# Altium schematic sheet 08_ANALOG_OUTPUTS.SchDoc: Схема электрическая принципиальная
size 420 x 297 mm; ApprovedBy: Скрябин; CheckedBy: Скрябин; Author: Корсунов; CompanyName: РТУ МИРЭА; SheetNumber: 8; SheetTotal: 11; PageSetup: Record=PageOptions|CenterHorizontal=True|CenterVertical=True|PrintScale=0.94|XCorrection=1.00|YCorrection=1.00|PrintKind=1|BorderSize=5000000|LeftOffset=0|BottomOffset=0|Orientation=1|PaperLength=1000|PaperWidth=1000|Scale=100|PaperSource=7|PrintQuality=-4|MediaType=1|DitherType=10|PaperKind=A4|PrintScaleMode=1; DecimalNumber: RP23.000001.008 Э3; Name1: Модуль ввода-вывода; lit_A: О; Name2: RP2350 OPC UA
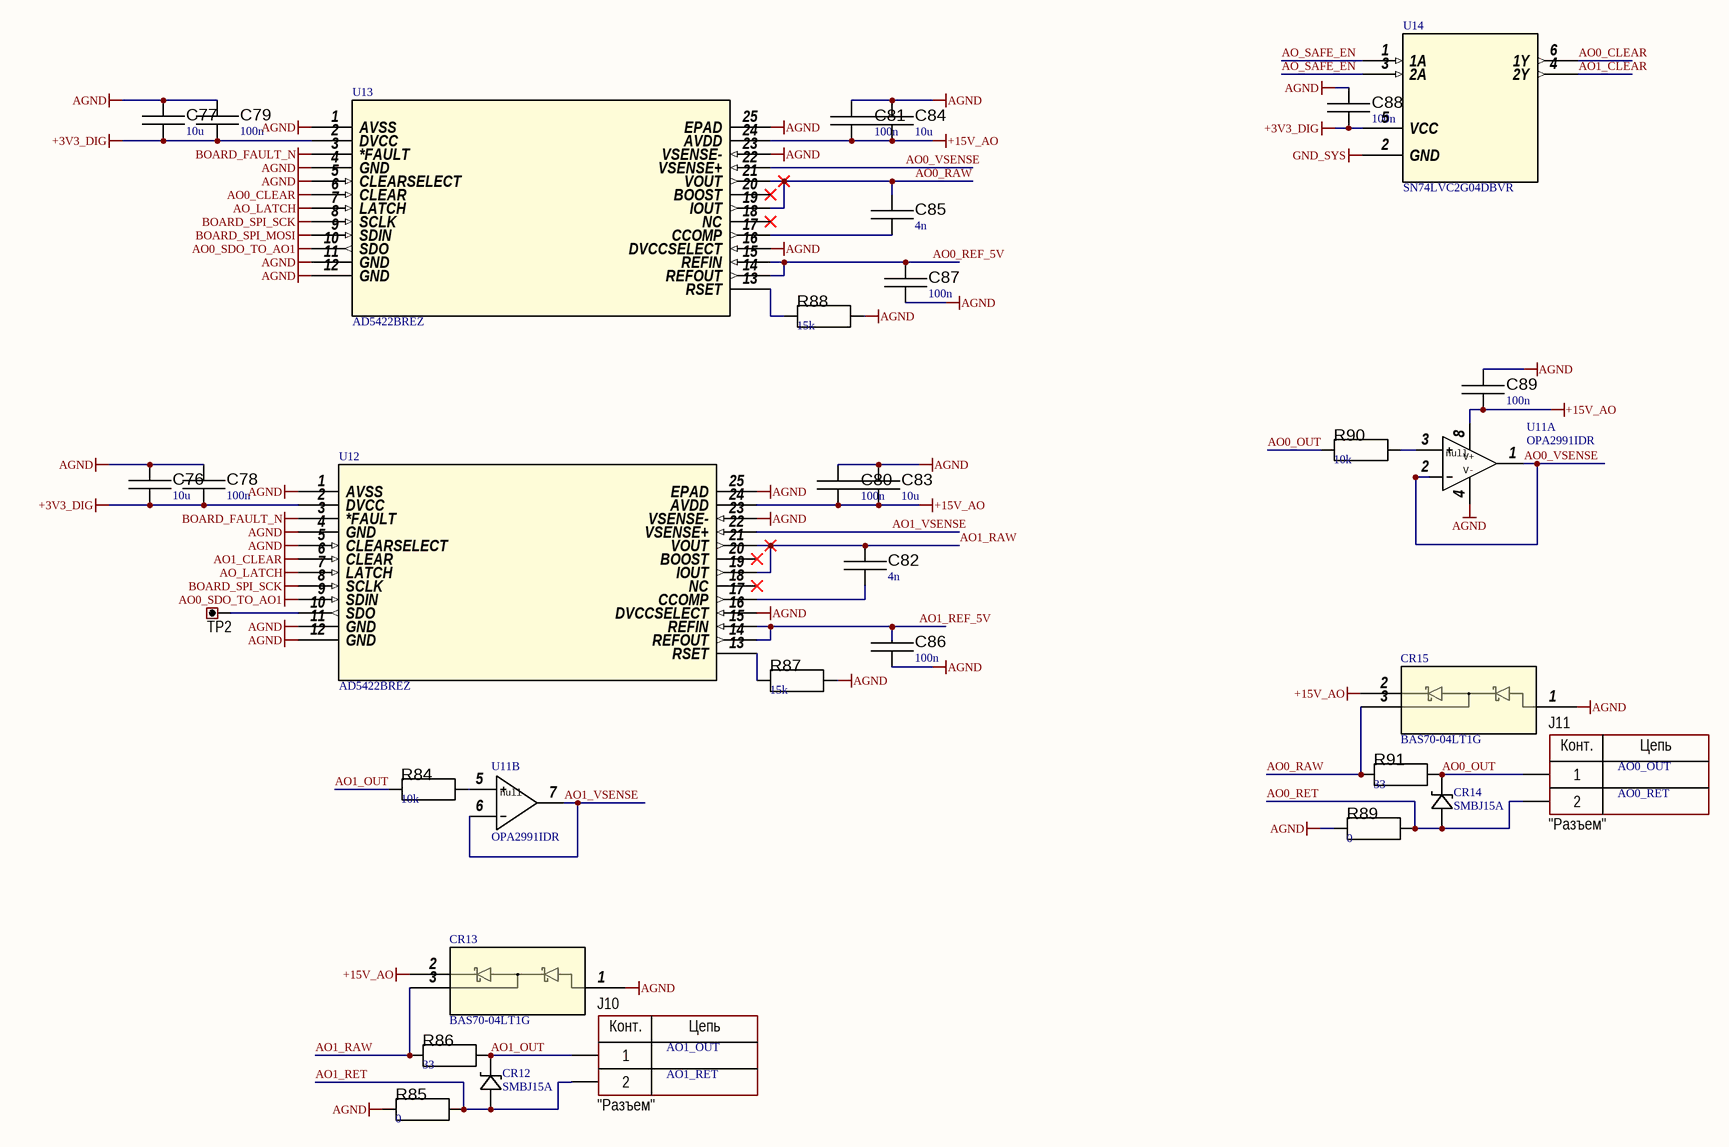
[diagram p0: 08_ANALOG_OUTPUTS.SchDoc]

## Parts
C76  value 10u  [C_0805]  (hidden comment: Capacitor)
C77  value 10u  [C_0805]  (hidden comment: Capacitor)
C78  value 100n  [C_0603]  (hidden comment: Capacitor)
C79  value 100n  [C_0603]  (hidden comment: Capacitor)
C80  value 100n  [C_0805]  (hidden comment: Capacitor)
C81  value 100n  [C_0805]  (hidden comment: Capacitor)
C82  value 4n  [C_0603]  (hidden comment: Capacitor)
C83  value 10u  [C_1206]  (hidden comment: Capacitor)
C84  value 10u  [C_1206]  (hidden comment: Capacitor)
C85  value 4n  [C_0603]  (hidden comment: Capacitor)
C86  value 100n  [C_0603]  (hidden comment: Capacitor)
C87  value 100n  [C_0603]  (hidden comment: Capacitor)
C88  value 100n  [C_0603]  (hidden comment: Capacitor)
C89  value 100n  [C_0805]  (hidden comment: Capacitor)
CR12  SMBJ15A  [DO-214AASMB_J-BEND_LTF]
CR13  BAS70-04LT1G  [SOT-23TO-236_318-08_ONS]
CR14  SMBJ15A  [DO-214AASMB_J-BEND_LTF]
CR15  BAS70-04LT1G  [SOT-23TO-236_318-08_ONS]
J10  CommentText: "Разъем"  [CON: DG350-3.5-02P]
J11  CommentText: "Разъем"  [CON: DG350-3.5-02P]
R84  value 10k  [R_0603]  (hidden comment: Resistor)
R85  value 0  [R_0603]  (hidden comment: Resistor)
R86  value 33  [R_0603]  (hidden comment: Resistor)
R87  value 15k  [R_0603]  (hidden comment: Resistor)
R88  value 15k  [R_0603]  (hidden comment: Resistor)
R89  value 0  [R_0603]  (hidden comment: Resistor)
R90  value 10k  [R_0603]  (hidden comment: Resistor)
R91  value 33  [R_0603]  (hidden comment: Resistor)
TP2  (no value)  [CON: 5000 (Keystone)]
U11  OPA2991IDR  [D0008A-IPC_A]  (parts A,B of 2)
U12  AD5422BREZ  [RE_24_ADI]
U13  AD5422BREZ  [RE_24_ADI]
U14  SN74LVC2G04DBVR  [DBV6]

## Nets
+3V3_DIG: C76.2 C77.2 C78.2 C79.2 C88.2 U12.2(DVCC) U13.2(DVCC) U14.5(VCC)
+15V_AO: C80.1 C81.1 C83.1 C84.1 C89.1 CR13.2 CR15.2 U11.8(V+) U12.24(AVDD) U13.24(AVDD)
AGND: C76.1 C77.1 C78.1 C79.1 C80.2 C81.2 C83.2 C84.2 C86.1 C87.1 C88.1 C89.2 CR13.1 CR15.1 R85.1 R87.2 R88.2 R89.1 U11.4(V-) U12.1(AVSS) U12.4(GND) U12.5(CLEARSELECT) U12.11(GND) U12.12(GND) U12.16(DVCCSELECT) U12.23(VSENSE-) U12.25(EPAD) U13.1(AVSS) U13.4(GND) U13.5(CLEARSELECT) U13.11(GND) U13.12(GND) U13.16(DVCCSELECT) U13.23(VSENSE-) U13.25(EPAD)
AO0_CLEAR: U13.6(CLEAR) U14.6(1Y)
AO0_SDO_TO_AO1: U12.9(SDIN) U13.10(SDO)
AO1_CLEAR: U12.6(CLEAR) U14.4(2Y)
AO_LATCH: U12.7(LATCH) U13.7(LATCH)
BOARD_FAULT_N: U12.3(*FAULT) U13.3(*FAULT)
BOARD_SPI_MOSI: U13.9(SDIN)
BOARD_SPI_SCK: U12.8(SCLK) U13.8(SCLK)
GND_SYS: U14.2(GND)
AO0_OUT: CR14.1 J11.1 R90.1 R91.2
AO0_RAW: C85.1 CR15.3 R91.1 U13.19(IOUT) U13.21(VOUT)
AO0_REF_5V: C87.2 U13.14(REFOUT) U13.15(REFIN)
AO0_RET: CR14.2 J11.2 R89.2
AO0_VSENSE: U11.1(OUT1) U11.2(IN1-) U13.22(VSENSE+)
AO1_OUT: CR12.1 J10.1 R84.1 R86.2
AO1_RAW: C82.1 CR13.3 R86.1 U12.19(IOUT) U12.21(VOUT)
AO1_REF_5V: C86.2 U12.14(REFOUT) U12.15(REFIN)
AO1_RET: CR12.2 J10.2 R85.2
AO1_VSENSE: U11.6(IN2-) U11.7(OUT2) U12.22(VSENSE+)
AO_SAFE_EN: U14.1(1A) U14.3(2A)
NetC82_2: C82.2 U12.17(CCOMP)
NetC85_2: C85.2 U13.17(CCOMP)
NetR84_2: R84.2 U11.5(IN2+)
NetR87_1: R87.1 U12.13(RSET)
NetR88_1: R88.1 U13.13(RSET)
NetR90_2: R90.2 U11.3(IN1+)
NetTP2_1: TP2.1 U12.10(SDO)

Not connected (* = marked no-connect by the designer): U12 18(NC)* 20(BOOST)*; U13 18(NC)* 20(BOOST)*

## Notes on the sheet
- AO0_OUT
- AO0_RET
- AO1_OUT
- AO1_RET
- Перв.примен.
- Справ.№
- Подп. и дата
- Инв.№ дубл.
- Взам.инв.№
- Подп.и дата
- Разраб.
- Изм.
- Лист
- № докум.
- Подп.
- Дата
- Лит.
- Масштаб
- Масса
- Т.контр.
- Пров.
- СХЕМА   ЭЛЕКТРИЧЕСКАЯ
- ПРИНЦИПИАЛЬНАЯ
- Листов
- Инв.№ подл.
- Утв.
- Н.контр.
- Нач.сект.
- Формат  A3
- (in symbol Connector_terminal_2pin) Конт.; Цепь
- (in symbol OPA2991IDR, part A) null
- (in symbol OPA2991IDR, part B) null

## Library data of the parts
C76-C89 = Capacitor: SimulationGenericComponent: True
CR12 CR14 = SMBJ15A: Description; Manufacturer_Name: Littelfuse Inc; Copyright: Copyright (C) 2025 Ultra Librarian. All rights reserved.; Manufacturer_Part_Number: SMBJ15A
CR13 CR15 = BAS70-04LT1G: No Description Available; Manufacturer_Name: onsemi; Copyright: Copyright (C) 2026 Ultra Librarian. All rights reserved.; Manufacturer_Part_Number: BAS70-04LT1G; RefDes: RefDes; Type: Type
J10 J11 = Connector_terminal_2pin: Manufacturer: Degson; ValueManufacturerPartNumber: Terminal connector, 2pin, 3.5mm, 300VAC, 10A; PartNumber: DG350-3.5-02P-14; TypeConnector: Terminal connector; VoltageMax: 300VAC; Pitch: 3.5mm; CurrentMax: 10A; Multichannel: 2pin; HelpURL: https://www.chipdip.ru/product/dg350-3.5-02p-12
R84 R86-R88 R90 R91 = Resistor: TC1: 0; SimulationGenericComponent: True; TC2: 0
R85 R89 = Resistor: SimulationGenericComponent: True; TC1: 0; TC2: 0
TP2 = Connector_Test_Point: Manufacturer: Keystone; ValueManufacturerPartNumber: Test point, Keystone, 5001; PartNumber: 5001; TypeConnector: Test point; HelpURL: https://www.digikey.com/product-detail/en/keystone-electronics/5001/36-5001-ND/255327
U11 = OPA2991IDR: Dual, 40-V, 4.5-MHz, low-power operational amplifier 8-SOIC -40 to 125; Manufacturer_Name: Texas Instruments; TYPE: TYPE; RefDes: RefDes; Copyright: Copyright (C) 2025 Ultra Librarian. All rights reserved.; Manufacturer_Part_Number: OPA2991IDR
U12 U13 = AD5422BREZ: Single Channel, 16-Bit, Current Source & Voltage Output DAC, HART Connectivity; Manufacturer_Name: Analog Devices Inc; Copyright: Copyright (C) 2026 Ultra Librarian. All rights reserved.; Manufacturer_Part_Number: AD5422BREZ; Datasheet: https://www.analog.com/media/en/technical-documentation/data-sheets/AD5412_5422.pdf; RefDes: RefDes; Type: Type
U14 = SN74LVC2G04DBVR: 2-ch, 1.65-V to 5.5-V inverters 6-SOT-23 -40 to 125; Manufacturer_Name: Texas Instruments; Copyright: Copyright (C) 2025 Ultra Librarian. All rights reserved.; Manufacturer_Part_Number: SN74LVC2G04DBVR; RefDes: RefDes; Type: Type